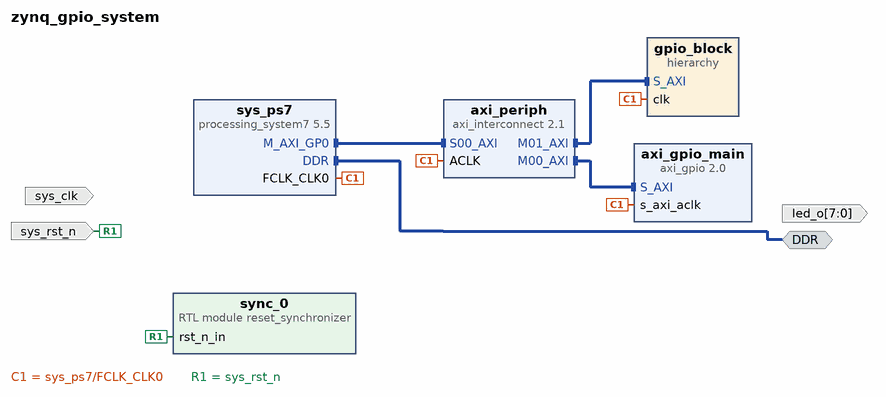
[diagram p0: block diagram of the top level]
# Vivado block design zynq_gpio_system, xc7z020clg400-1, Vivado 2022.2
create_bd_design zynq_gpio_system

create_bd_intf_port -mode Master -vlnv xilinx.com:interface:ddrx_rtl:1.0 DDR
create_bd_port -dir I -type clk sys_clk
set_property -dict {CONFIG.FREQ_HZ 125000000} [get_bd_ports sys_clk]
create_bd_port -dir I -type rst sys_rst_n
create_bd_port -dir O -from 7 -to 0 led_o

create_bd_cell -type ip -vlnv xilinx.com:ip:processing_system7:5.5 sys_ps7
set_property -dict {CONFIG.PCW_FPGA0_PERIPHERAL_FREQMHZ 150} [get_bd_cells sys_ps7]
# 1 more settings of sys_ps7 are not shown: defaults, MIO pin electricals, DDR timing, and values the tool derives
create_bd_cell -type ip -vlnv xilinx.com:ip:axi_interconnect:2.1 axi_periph
set_property -dict {CONFIG.NUM_MI 2} [get_bd_cells axi_periph]
create_bd_cell -type ip -vlnv xilinx.com:ip:axi_gpio:2.0 axi_gpio_main
set_property -dict {CONFIG.C_GPIO_WIDTH 8} [get_bd_cells axi_gpio_main]
create_bd_cell -type hier gpio_block
create_bd_cell -type module -reference reset_synchronizer sync_0

# ---- hierarchy /gpio_block ----
current_bd_instance /gpio_block
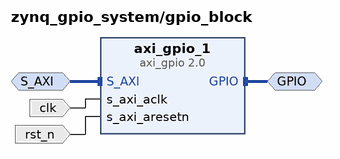
[diagram p1: block diagram inside /gpio_block]
create_bd_intf_pin -mode Slave -vlnv xilinx.com:interface:aximm_rtl:1.0 S_AXI
create_bd_intf_pin -mode Master -vlnv xilinx.com:interface:gpio_rtl:1.0 GPIO
create_bd_pin -dir I -type clk clk
create_bd_pin -dir I -type rst rst_n

create_bd_cell -type ip -vlnv xilinx.com:ip:axi_gpio:2.0 axi_gpio_1
set_property -dict {CONFIG.C_ALL_OUTPUTS 1} [get_bd_cells axi_gpio_1]

# ---- connections ----

current_bd_instance /gpio_block
connect_bd_intf_net -intf_net gpio_axi [get_bd_intf_pins S_AXI] [get_bd_intf_pins axi_gpio_1/S_AXI]
connect_bd_intf_net -intf_net gpio_pins [get_bd_intf_pins axi_gpio_1/GPIO] [get_bd_intf_pins GPIO]
connect_bd_net -net block_clk [get_bd_pins clk] [get_bd_pins axi_gpio_1/s_axi_aclk]
connect_bd_net -net block_rst [get_bd_pins rst_n] [get_bd_pins axi_gpio_1/s_axi_aresetn]

current_bd_instance /
connect_bd_intf_net -intf_net ps_axi [get_bd_intf_pins axi_periph/S00_AXI] [get_bd_intf_pins sys_ps7/M_AXI_GP0]
connect_bd_intf_net -intf_net periph_gpio0 [get_bd_intf_pins axi_periph/M00_AXI] [get_bd_intf_pins axi_gpio_main/S_AXI]
connect_bd_intf_net -intf_net periph_block [get_bd_intf_pins axi_periph/M01_AXI] [get_bd_intf_pins gpio_block/S_AXI]
connect_bd_intf_net -intf_net ps_ddr [get_bd_intf_pins sys_ps7/DDR] [get_bd_intf_ports DDR]
connect_bd_net -net fclk [get_bd_pins sys_ps7/FCLK_CLK0] \
  [get_bd_pins axi_periph/ACLK] [get_bd_pins axi_gpio_main/s_axi_aclk] [get_bd_pins gpio_block/clk]
connect_bd_net -net ext_rst [get_bd_ports sys_rst_n] [get_bd_pins sync_0/rst_n_in] [get_bd_pins ghost_ctrl/rst_n]

# ---- address map ----
assign_bd_address -offset 0x00000000 -range 4G -target_address_space [get_bd_addr_spaces sys_ps7/Data] [get_bd_addr_segs axi_gpio_main/S_AXI/Mem]
assign_bd_address -offset 0x41200000 -range 64K -target_address_space [get_bd_addr_spaces sys_ps7/Data] [get_bd_addr_segs axi_gpio_main/S_AXI/Reg]
assign_bd_address -offset 0x41210000 -range 64K -target_address_space [get_bd_addr_spaces sys_ps7/Data] [get_bd_addr_segs gpio_block/axi_gpio_1/S_AXI/Reg]
exclude_bd_addr_seg -offset 0x41220000 -range 4K -target_address_space [get_bd_addr_spaces sys_ps7/Data] [get_bd_addr_segs axi_gpio_main/S_AXI/Reg2]
exclude_bd_addr_seg -offset 0x41230000 -range 4K -target_address_space [get_bd_addr_spaces sys_ps7/Data] [get_bd_addr_segs axi_gpio_main/S_AXI/Reg3]

validate_bd_design
save_bd_design
